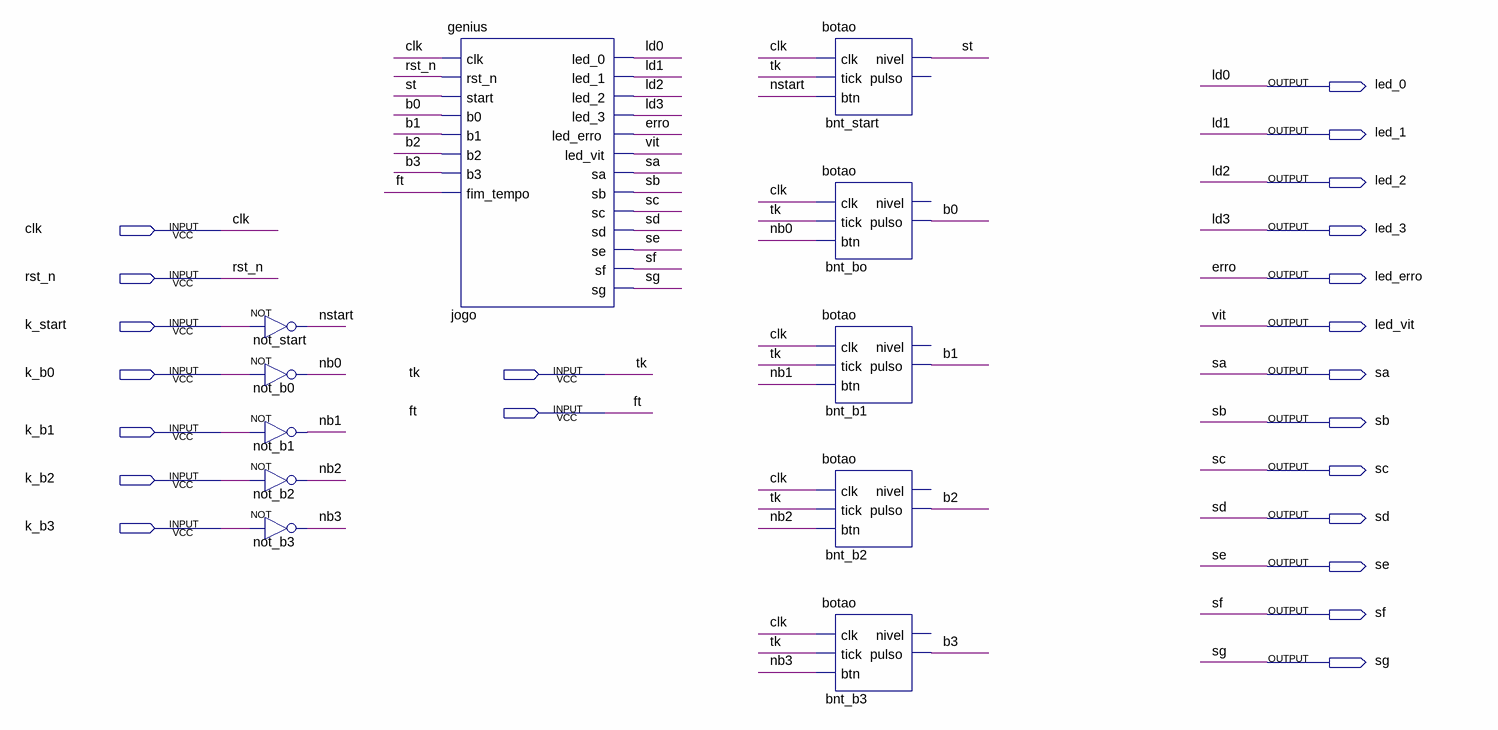
[diagram p0: schematic sheet]
// Quartus schematic genius_placa_teste.bdf as structural Verilog: 11 symbols, 22 pins
module genius_placa_teste (
  input  clk,
  input  rst_n,
  input  k_start,
  input  k_b0,
  input  tk,
  input  ft,
  input  k_b1,
  input  k_b2,
  input  k_b3,
  output led_0,
  output led_1,
  output led_2,
  output led_3,
  output led_erro,
  output led_vit,
  output sa,
  output sb,
  output sc,
  output sd,
  output se,
  output sf,
  output sg
);

  wire b0, b1, b2, b3, nb0, nb1, nb2, nb3, nstart, st;

  not not_start (nstart, k_start);
  not not_b0 (nb0, k_b0);
  not not_b1 (nb1, k_b1);
  not not_b2 (nb2, k_b2);
  not not_b3 (nb3, k_b3);
  genius jogo (
    .clk(clk), .rst_n(rst_n), .start(st), .b0(b0), .b1(b1), .b2(b2), .b3(b3), .fim_tempo(ft), .led_0(led_0),
    .led_1(led_1), .led_2(led_2), .led_3(led_3), .led_erro(led_erro), .led_vit(led_vit), .sa(sa), .sb(sb),
    .sc(sc), .sd(sd), .se(se), .sf(sf), .sg(sg));
  botao bnt_start (.clk(clk), .tick(tk), .btn(nstart), .nivel(st));  // open: pulso
  botao bnt_bo (.clk(clk), .tick(tk), .btn(nb0), .pulso(b0));  // open: nivel
  botao bnt_b1 (.clk(clk), .tick(tk), .btn(nb1), .pulso(b1));  // open: nivel
  botao bnt_b2 (.clk(clk), .tick(tk), .btn(nb2), .pulso(b2));  // open: nivel
  botao bnt_b3 (.clk(clk), .tick(tk), .btn(nb3), .pulso(b3));  // open: nivel

  // Other names for the same wires on the sheet: erro = led_erro; ld0 = led_0; ld1 = led_1; ld2 = led_2; ld3 = led_3;
  //   vit = led_vit
endmodule
